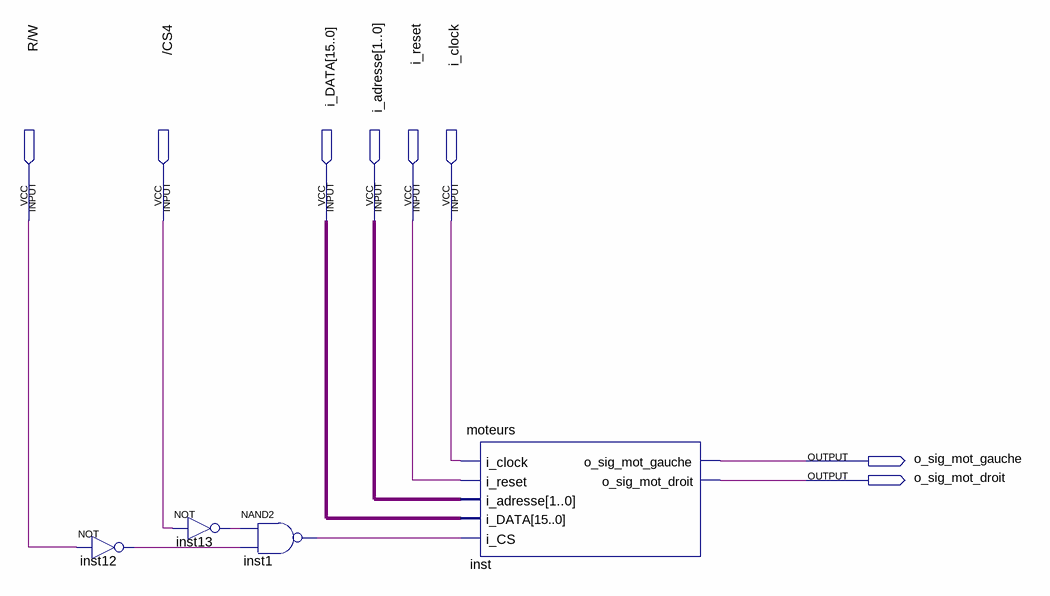
[diagram p0: schematic sheet]
// Quartus schematic moteur_robot.bdf as structural Verilog: 4 symbols, 8 pins
module moteur_robot (
  input  \R/W ,
  input  \/CS4 ,
  input  [15:0] i_DATA,
  input  [1:0] i_adresse,
  input  i_reset,
  input  i_clock,
  output o_sig_mot_gauche,
  output o_sig_mot_droit
);

  wire inst1_out, inst12_out, inst13_out;

  not inst12 (inst12_out, \R/W );
  not inst13 (inst13_out, \/CS4 );
  nand inst1 (inst1_out, inst13_out, inst12_out);
  moteurs inst (
    .i_clock(i_clock), .i_reset(i_reset), .i_adresse(i_adresse), .i_DATA(i_DATA), .i_CS(inst1_out),
    .o_sig_mot_gauche(o_sig_mot_gauche), .o_sig_mot_droit(o_sig_mot_droit));
endmodule
